# Altium schematic sheet ESP32_EC.SchDoc (part 2 of 3)
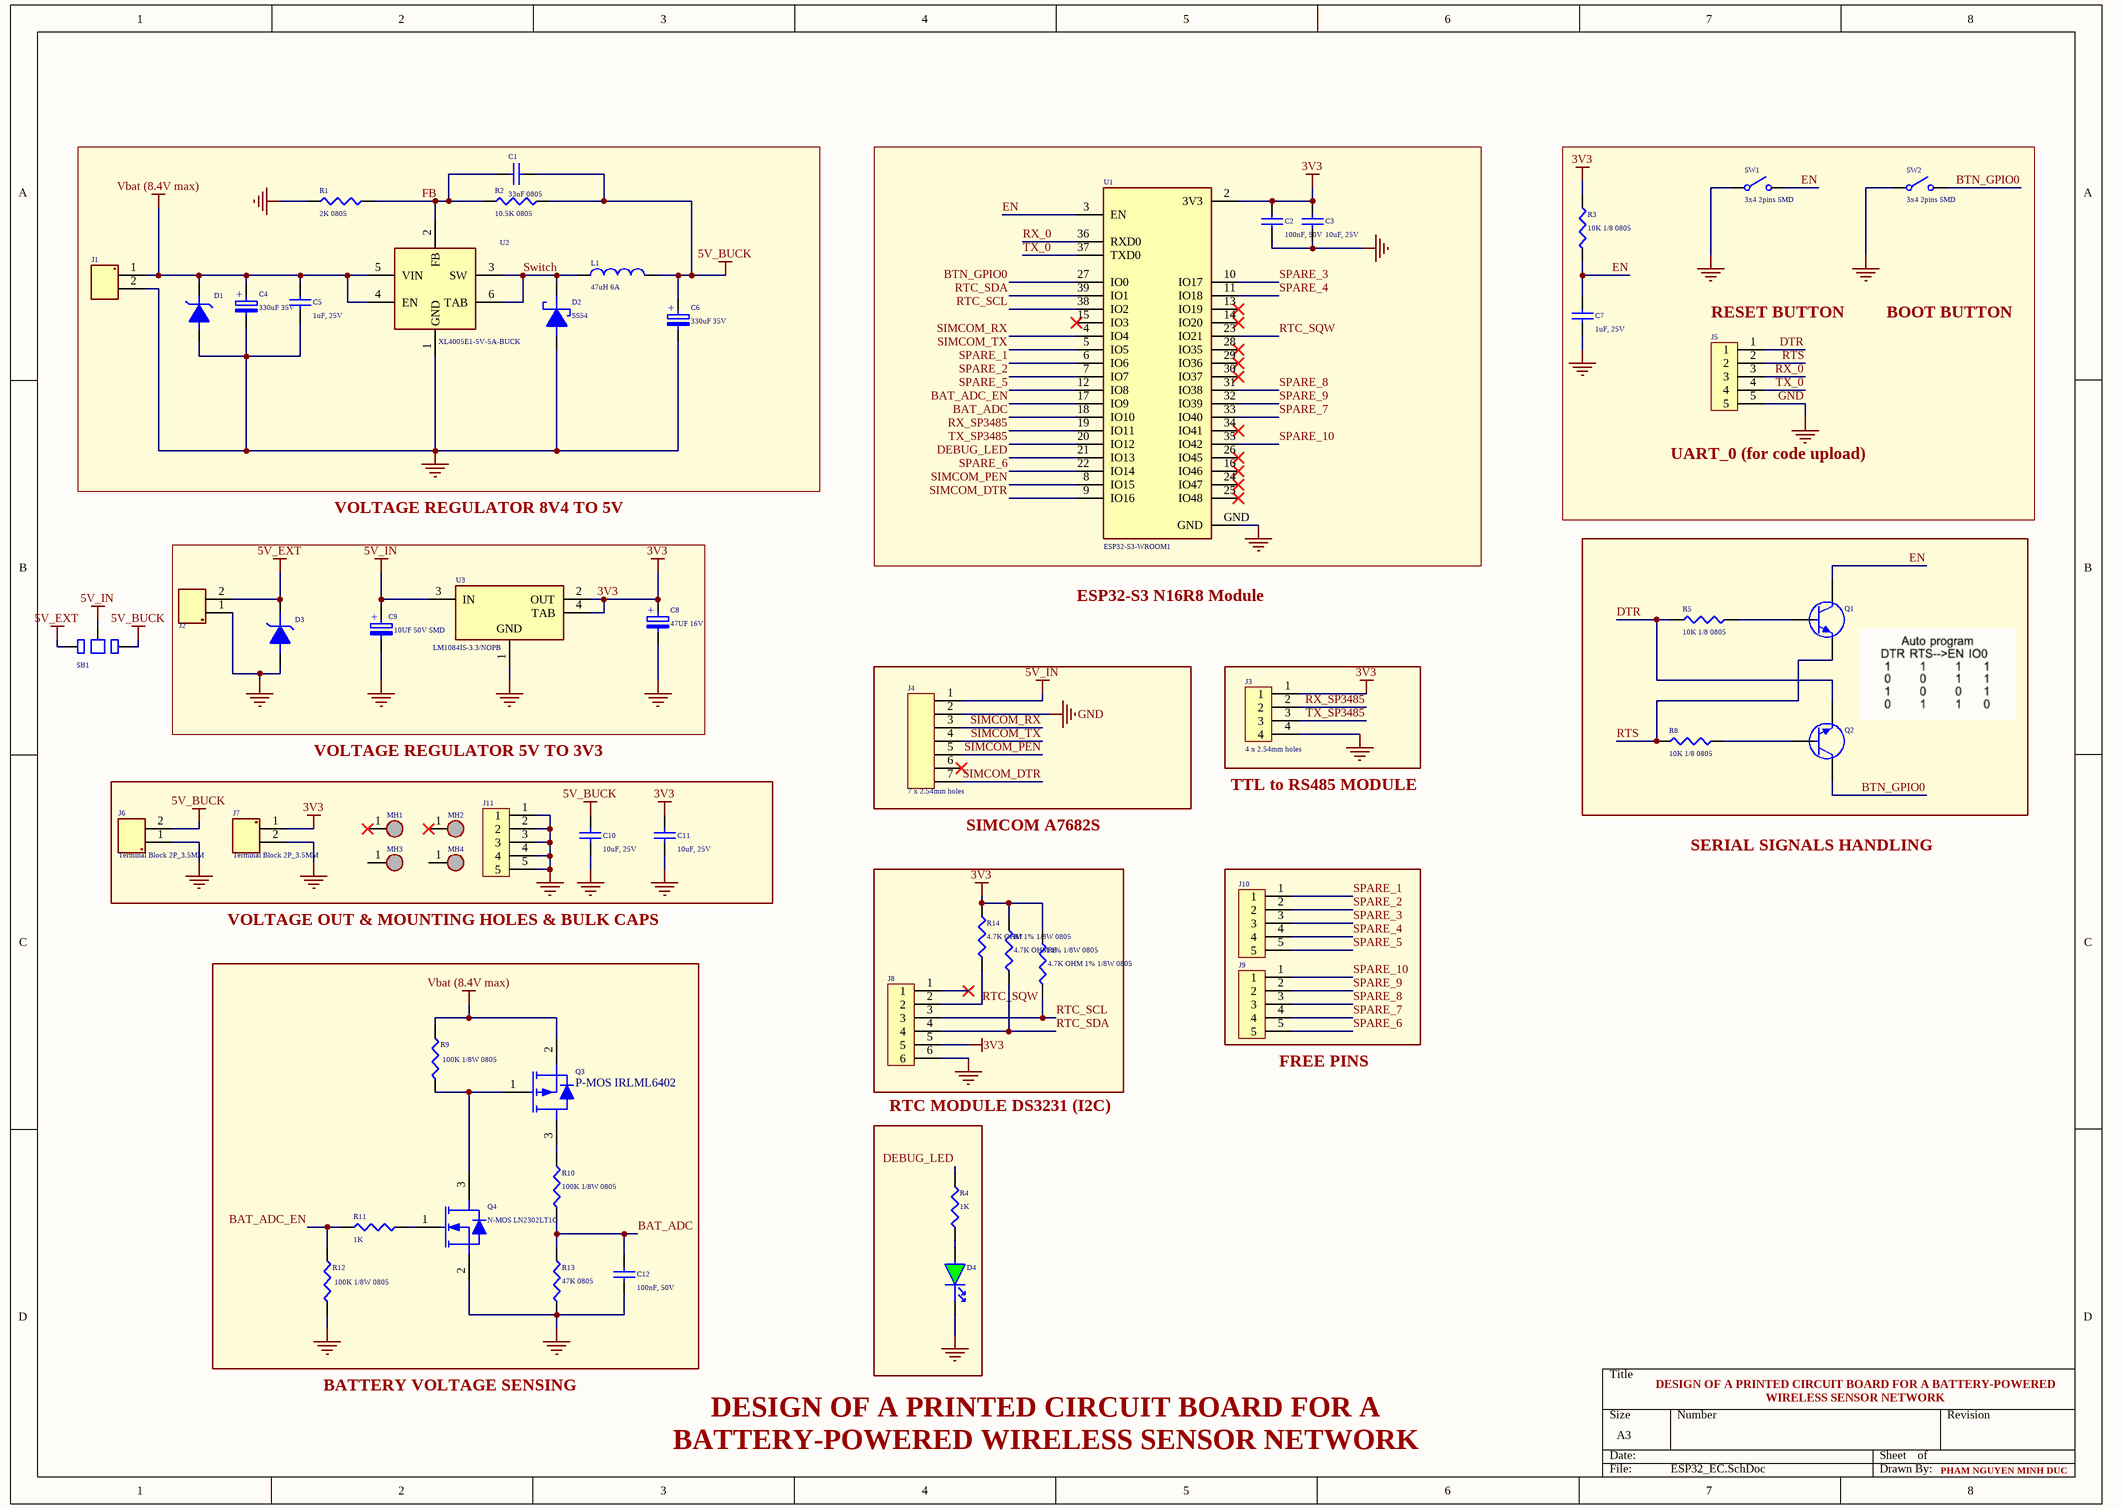
[diagram p1: ESP32_EC.SchDoc]
## Library data of the parts
C1 = C0805C333F3GEC7210: CAP CER 0805 33nF 1%; Manufacturer: KEMET; Dielectric Material: Ceramic; Voltage Rating (DC): 25V; Supplier: DigiKey; Supplier Part Number: 399-C0805C333F3GEC7210CT-ND; Manufacturer Part Number: C0805C333F3GEC7210; RoHS: Compliant; Category: Ceramic Capacitors; Stock: 4179; Pricing: 1=1.4, 10=0.879, 50=0.7314, 100=0.6728, 500=0.5736, 1000=0.54292, 2500=0.51378 (USD); Value: 33nF; Height: 1.25mm; Length: 2mm; Lifecycle Status: Production; Max Operating Temperature: 125°C; Min Operating Temperature: -55°C; Mounting Technology: Surface Mount; Number of Terminals: 2; REACH SVHC: Yes; Width: 1.25mm; ComponentLink1URL: https://datasheet.octopart.com:443/C0805C333F3GEC7210-KEMET-datasheet-176292478.pdf?src-supplier=IHS; ComponentLink1Description: https://datasheet.octopart.com:443/C0805C333F3GEC7210-KEMET-datasheet-176292478.pdf?src-supplier=IHS
C2 C12 = CL21B104KBCNNNC: 50V 100nF X7R ±10% 0805 Multilayer Ceramic Capacitors MLCC - SMD/SMT ROHS; Manufacturer: Samsung; Multilayer: Yes; Supplier: Digikey; Supplier Part Number: 1276-1003-6-ND; Manufacturer Part Number: CL21B104KBCNNNC; RoHS: Yes; Category: Ceramic Capacitors; Stock: 2034358; Pricing: 1=0.1, 10=0.035, 50=0.0238, 100=0.0203, 500=0.01446, 1000=0.01266 (USD); Mounting Technology: Surface Mount; Pins: 2; Dielectric Material: Ceramic; Package Shape: Rectangular; Case/Package: 0805; Terminal Finish: Nickel; Min Operating Temperature: -55°C; Max Operating Temperature: 125°C; JESD-609 Code: e3; Value: 100nF; Capacitor Type: Ceramic; Tolerance  (fill in as +-): 10%; Package Style: SMTMeter; Packaging: Tape and Reel; Tolerance (fill in as +-): 10%; Rated DC Voltage (URdc): 50V; Temperature Characteristics Code: X7R; Termination: Wraparound; Length: 2mm; Width: 1.25mm; Height: 0.95mm; Reach SVHC Compliant: Yes; RoHS Compliant: Yes; LCSC Part Number: C1711
C3 C10 C11 = CL21B106KAYQNNE: 25V 10uF X7R ±10% 0805 Multilayer Ceramic Capacitors MLCC - SMD/SMT ROHS; Manufacturer: Samsung; Multilayer: Yes; Supplier: Digikey; Supplier Part Number: 1276-CL21B106KAYQNNECT-ND; Manufacturer Part Number: CL21B106KAYQNNE; RoHS: Yes; Category: Ceramic Capacitors; Pricing: 1=0.35, 10=0.206, 50=0.1484, 100=0.1304, 500=0.09992, 1000=0.09042 (USD); Mounting Technology: Surface Mount; Pins: 2; Dielectric Material: Ceramic; Package Shape: Rectangular; Case/Package: 0805; Min Operating Temperature: -55°C; Max Operating Temperature: 125°C; Value: 10uF; Capacitor Type: Ceramic; Tolerance  (fill in as +-): 10%; Packaging: Tape and Reel; Tolerance (fill in as +-): 10%; Rated DC Voltage (URdc): 25V; Temperature Characteristics Code: X7R; Termination: Wraparound; Reach SVHC Compliant: Yes; RoHS Compliant: No; ComponentLink1URL: https://datasheet.ciiva.com:443/pdfs/VipMasterIC/IC/SEMS/SEMS-S-A0005593215/SEMS-S-A0005590463-1.pdf?src-supplier=IHS+Markit; ComponentLink1Description: https://datasheet.ciiva.com:443/pdfs/VipMasterIC/IC/SEMS/SEMS-S-A0005593215/SEMS-S-A0005590463-1.pdf?src-supplier=IHS+Markit; LCSC Part Number: C3039694
C4 C6 = EEH-ZS1V331P: 330uF 35V ±30% SMD,D10xL10.2mm Aluminum Electrolytic Capacitors - SMD ROHS; Manufacturer: Panasonic; Supplier: Digikey; Supplier Part Number: 10-EEH-ZS1V331PCT-ND; Manufacturer Part Number: EEH-ZS1V331P; RoHS: Yes; Category: Polymer Capacitors; Stock: 2119; Pricing: 1=2.29, 10=1.477, 50=1.1476, 100=1.045 (USD); LCSC Number Part: C2895745
C5 = CL21B105KAFNNNE: 25V 1uF X7R ±10% 0805 Multilayer Ceramic Capacitors MLCC - SMD/SMT ROHS; Manufacturer: Samsung; Multilayer: Yes; Supplier: Digikey; Supplier Part Number: 1276-1066-1-ND; Manufacturer Part Number: CL21B105KAFNNNE; RoHS: Yes; Category: Ceramic Capacitors; Stock: 1189368; Pricing: 1=0.1, 10=0.046, 50=0.0318, 100=0.0273, 500=0.01968, 1000=0.01731, 2000=0.01536, 4000=0.01375, 6000=0.01294, 10000=0.01204, 14000=0.01151, 20000=0.011, 50000=0.0099, 100000=0.00923, 200000=0.00868 (USD); Mounting Technology: Surface Mount; Pins: 2; Dielectric Material: Ceramic; Package Shape: Rectangular; Case/Package: 0805; Terminal Finish: Nickel; Min Operating Temperature: -55°C; Max Operating Temperature: 125°C; JESD-609 Code: e3; Value: 1uF; Capacitor Type: Ceramic; Tolerance  (fill in as +-): 10%; Package Style: SMTMeter; Packaging: Tape and Reel; Tolerance (fill in as +-): 10%; Rated DC Voltage (URdc): 25V; Temperature Characteristics Code: X7R; Termination: Wraparound; Length: 2mm; Width: 1.25mm; Height: 1.35mm; Reach SVHC Compliant: Yes; RoHS Compliant: Yes; ComponentLink1URL: https://datasheet.ciiva.com:443/pdfs/VipMasterIC/IC/SEMS/SEMS-S-A0008523501/SEMS-S-A0008523563-1.pdf?src-supplier=IHS+Markit; ComponentLink1Description: https://datasheet.ciiva.com:443/pdfs/VipMasterIC/IC/SEMS/SEMS-S-A0008523501/SEMS-S-A0008523563-1.pdf?src-supplier=IHS+Markit; ComponentLink2URL: https://datasheet.ciiva.com/25800/cl21b105kafnnne-25800163.pdf?src-supplier=Digikey; ComponentLink2Description: https://datasheet.ciiva.com/25800/cl21b105kafnnne-25800163.pdf?src-supplier=Digikey; ComponentLink3URL: https://datasheet.ciiva.com/15195/getdatasheetpartid-355205-15195880.pdf?src-supplier=Verical; ComponentLink3Description: https://datasheet.ciiva.com/15195/getdatasheetpartid-355205-15195880.pdf?src-supplier=Verical; LCSC Part Number: C116352
C7 = 3372-0805B105J250CCTR-ND: 1uF ±10% 50V Ceramic Capacitor X7R 0805; LCSC Part Number: C215803
C8 = 16SVPG47M: CAP ALUM POLY 47UF 20% 16V SMD D5.00; Manufacturer: Panasonic; Manufacturer Lifecycle Status: ACTIVE; Part Series: SVPG; Value: 47µF; Dissipation Factor: 12%; ESR (Equivalent Series Resistance): 25mΩ; Leakage Current: 150µA; Life (Hours): 5000hours; Material: Polymer; Polarity: Polar; Ripple Current: 160mA; Supplier: DigiKey; Supplier Part Number: P18930CT-ND; Manufacturer Part Number: 16SVPG47M; RoHS: Compliant; Category: Aluminum Electrolytic Capacitors; Stock: 12369; Pricing: 1=1.43, 10=0.92, 50=0.7086, 100=0.6416, 500=0.52624, 1000=0.48992 (USD); Case/Package: Radial; Diameter: 5mm; Height: 4.4mm; Height - Seated (Max): 4.4958mm; Length: 5.3mm; Lifecycle Status: Production; Max Operating Temperature: 105°C; Min Operating Temperature: -55°C; Mounting Technology: Surface Mount; Number of Terminals: 2; REACH SVHC: Yes; Schedule B: 8532220020, 8532220020|8532220020, 8532220020|8532220020|8532220020, 8532220020|8532220020|8532220020|8532220020; Tolerance: 20%; Voltage Rating: 16V; Voltage Rating (DC): 16V; Width: 5.3mm; ComponentLink1URL: https://datasheet.octopart.com:443/16SVPG47M-Panasonic-datasheet-182100668.pdf?src-supplier=IHS; ComponentLink1Description: https://datasheet.octopart.com:443/16SVPG47M-Panasonic-datasheet-182100668.pdf?src-supplier=IHS; ComponentLink2URL: https://datasheet.octopart.com:443/16SVPG47M-Panasonic-datasheet-62065354.pdf?src-supplier=Panasonic; ComponentLink2Description: https://datasheet.octopart.com:443/16SVPG47M-Panasonic-datasheet-62065354.pdf?src-supplier=Panasonic; ComponentLink3URL: https://sigma.octopart.com:443/138897373/technical_drawing/Panasonic-16SVPG47M.pdf?src-supplier=Upverter; ComponentLink3Description: https://sigma.octopart.com:443/138897373/technical_drawing/Panasonic-16SVPG47M.pdf?src-supplier=Upverter; ComponentLink4URL: https://datasheet.octopart.com:443/16SVPG47M-Panasonic-datasheet-102492111.pdf?src-supplier=Farnell; ComponentLink4Description: https://datasheet.octopart.com:443/16SVPG47M-Panasonic-datasheet-102492111.pdf?src-supplier=Farnell; ComponentLink5URL: https://datasheet.octopart.com:443/16SVPG47M-Panasonic-datasheet-38538411.pdf?src-supplier=Newark; ComponentLink5Description: https://datasheet.octopart.com:443/16SVPG47M-Panasonic-datasheet-38538411.pdf?src-supplier=Newark; ComponentLink6URL: https://datasheet.octopart.com:443/16SVPG47M-Panasonic-datasheet-151609408.pdf?src-supplier=Master+Electronics; ComponentLink6Description: https://datasheet.octopart.com:443/16SVPG47M-Panasonic-datasheet-151609408.pdf?src-supplier=Master+Electronics; ComponentLink7URL: https://sigma.octopart.com:443/150570690/technical_drawing/Panasonic-16SVPG47M.pdf?src-supplier=Panasonic+SCT; ComponentLink7Description: https://sigma.octopart.com:443/150570690/technical_drawing/Panasonic-16SVPG47M.pdf?src-supplier=Panasonic+SCT; ComponentLink8URL: https://datasheet.octopart.com:443/16SVPG47M-Panasonic-datasheet-138704366.pdf?src-supplier=TME; ComponentLink8Description: https://datasheet.octopart.com:443/16SVPG47M-Panasonic-datasheet-138704366.pdf?src-supplier=TME
C9 = EEH-ZA1H100R: CAP ALUM HYBRID 10UF 20% 50V SMD (D5L6P10); Manufacturer: Panasonic; Dielectric Material: Aluminium; Polarity: Polarized; ESR (Equivalent Series Resistance): 120mR; Leakage Current: 5uA; Ripple Current: 75mA; Tan Delta: 0.1; Reference Standard: AEC-Q200; Supplier: Digikey; Supplier Part Number: 10-EEH-ZA1H100RCT-ND; Manufacturer Part Number: EEH-ZA1H100R; RoHS: Yes; Category: Polymer Capacitors; Stock: 1272; Pricing: 1=1.36, 10=0.853, 50=0.6486, 100=0.5847, 500=0.47586 (USD); Mounting Technology: Surface Mount; Pins: 2; Case/Package: 2121; Min Operating Temperature: -55°C; Max Operating Temperature: 105°C; Value: 10uF; Capacitor Type: Aluminium; Tolerance  (fill in as +-): 20%; Package Style: SMTMeter; Packaging: Tape and Reel; Tolerance (fill in as +-): 20%; Rated DC Voltage (URdc): 50V; Termination: Flat; Diameter: 5mm; Length: 5.8mm; Reach SVHC Compliant: Yes; RoHS Compliant: Yes; ComponentLink1URL: https://datasheet.ciiva.com:443/pdfs/VipMasterIC/IC/PANA/PANA-S-A0009553130/PANA-S-A0009553130-1.pdf?src-supplier=IHS+Markit; ComponentLink1Description: https://datasheet.ciiva.com:443/pdfs/VipMasterIC/IC/PANA/PANA-S-A0009553130/PANA-S-A0009553130-1.pdf?src-supplier=IHS+Markit; ComponentLink2URL: https://datasheet.ciiva.com/25613/0900766b81233638-25613634.pdf?src-supplier=Rs; ComponentLink2Description: https://datasheet.ciiva.com/25613/0900766b81233638-25613634.pdf?src-supplier=Rs; ComponentLink3URL: https://datasheet.ciiva.com/22730/1536543-22730556.pdf?src-supplier=Element14; ComponentLink3Description: https://datasheet.ciiva.com/22730/1536543-22730556.pdf?src-supplier=Element14; ComponentLink4URL: https://datasheet.ciiva.com/28691/1536543-28691417.pdf?src-supplier=Element14; ComponentLink4Description: https://datasheet.ciiva.com/28691/1536543-28691417.pdf?src-supplier=Element14; ComponentLink5URL: https://datasheet.ciiva.com/7794/1536543-7794234.pdf?src-supplier=Element14; ComponentLink5Description: https://datasheet.ciiva.com/7794/1536543-7794234.pdf?src-supplier=Element14; ComponentLink6URL: https://datasheet.ciiva.com/6121/1536543-6121368.pdf?src-supplier=Farnell; ComponentLink6Description: https://datasheet.ciiva.com/6121/1536543-6121368.pdf?src-supplier=Farnell; ComponentLink7URL: https://datasheet.ciiva.com/11679/aba0000ce136-11679434.pdf?src-supplier=Avnet; ComponentLink7Description: https://datasheet.ciiva.com/11679/aba0000ce136-11679434.pdf?src-supplier=Avnet; ComponentLink8URL: https://datasheet.ciiva.com/6327/aba0000ce136-6327913.pdf?src-supplier=Digikey; ComponentLink8Description: https://datasheet.ciiva.com/6327/aba0000ce136-6327913.pdf?src-supplier=Digikey; ComponentLink9URL: https://datasheet.ciiva.com/6327/aba0000ce136-6327914.pdf?src-supplier=Digikey; ComponentLink9Description: https://datasheet.ciiva.com/6327/aba0000ce136-6327914.pdf?src-supplier=Digikey; ComponentLink10URL: https://datasheet.ciiva.com/6327/aba0000ce136-6327916.pdf?src-supplier=Digikey; ComponentLink10Description: https://datasheet.ciiva.com/6327/aba0000ce136-6327916.pdf?src-supplier=Digikey; ComponentLink11URL: https://datasheet.ciiva.com/10331/aba0000ce136-10331175.pdf?src-supplier=Avnet; ComponentLink11Description: https://datasheet.ciiva.com/10331/aba0000ce136-10331175.pdf?src-supplier=Avnet
D1 = SMAJ12A: TVS DIODE 12VWM 20.9VC DO214AC; Datasheet: https://www.littelfuse.com/~/media/electronics/datasheets/tvs_diodes/littelfuse_tvs_diode_smaj_datasheet.pdf.pdf; LCSC Number Part: C148213
D2 = SS54: Diode 40 V 5A Surface Mount DO-214AC (SMA); LCSC Number Part: C22452; Datasheet: https://www.lcsc.com/datasheet/lcsc_datasheet_2209161430_SUNMATE-Elec-SS34_C5155170.pdf
D3 = SMAJ5A: 43.5A 400W 9.2V 6.4V 5V SMA(DO-214AC) ESD and Surge Protection (TVS/ESD) ROHS; Manufacturer: Littelfuse; Manufacturer Part Number: SMAJ5.0A; LSCS Part Number: C223992; Diode Element Material: SILICON; Package Body Material: Plastic; Polarity: Unidirectional; Diode Type: TRANS VOLTAGE SUPPRESSOR; Non-rep Peak Rev Power Dis-Max: 50kW; Number of Elements: 1; Time @ Peak Reflow Temperature-Max (s): 30s; Max Breakdown Voltage: 7V; Breakdown Voltage-Nom: 6.7V; Qualification Status: Not Qualified; Supplier: Digikey; Supplier Part Number: SMAJ5.0ALFCT-ND; RoHS: Yes; Category: TVS Diodes; Stock: 63263; Pricing: 1=0.3, 10=0.205, 100=0.1376, 500=0.1061, 1000=0.09556, 2000=0.08656, 5000=0.07665, 10000=0.07044, 15000=0.06725, 25000=0.06365, 35000=0.06151, 50000=0.05942, 125000=0.05912 (USD); Pins: 2; Package Shape: Rectangular; Terminal Finish: Tin; Min Operating Temperature: -65°C; Max Operating Temperature: 150°C; JESD-609 Code: e3; Min Breakdown Voltage: 6.4V; Clamping Voltage-Max: 9.2V; JESD-30 Code: R-PDSO-C2; Moisture Sensitivity Level: 1; Package Style: SMALL OUTLINEMeter; Peak Reflow Temperature (Cel): 260°C; Surface Mount: Yes; Technology: AVALANCHE; Terminal Form: C BEND; Terminal Position: DUAL; Rep Pk Reverse Voltage-Max: 5V; JEDEC-95 Code: DO-214AC; RoHS Compliant: Yes; Reach SVHC Compliant: No; ComponentLink1URL: https://datasheet.ciiva.com:443/pdfs/VipMasterIC/IC/LFSI/LFSI-S-A0001360630/LFSI-S-A0001360630-1.pdf?src-supplier=IHS+Markit; ComponentLink1Description: https://datasheet.ciiva.com:443/pdfs/VipMasterIC/IC/LFSI/LFSI-S-A0001360630/LFSI-S-A0001360630-1.pdf?src-supplier=IHS+Markit; ComponentLink2URL: https://datasheet.ciiva.com/25624/0900766b810f4edb-25624839.pdf?src-supplier=Rs; ComponentLink2Description: https://datasheet.ciiva.com/25624/0900766b810f4edb-25624839.pdf?src-supplier=Rs; ComponentLink3URL: https://datasheet.ciiva.com/8062/littelfuse-tvs-diode-smaj-8062271.pdf?src-supplier=Element14; ComponentLink3Description: https://datasheet.ciiva.com/8062/littelfuse-tvs-diode-smaj-8062271.pdf?src-supplier=Element14; ComponentLink4URL: https://datasheet.ciiva.com/4507/littelfuse-tvs-diode-smaj-23503-4507964.pdf?src-supplier=Mouser; ComponentLink4Description: https://datasheet.ciiva.com/4507/littelfuse-tvs-diode-smaj-23503-4507964.pdf?src-supplier=Mouser; ComponentLink5URL: https://datasheet.ciiva.com/16380/littelfuse-tvs-diode-smaj-16380982.pdf?src-supplier=Future+Electronics; ComponentLink5Description: https://datasheet.ciiva.com/16380/littelfuse-tvs-diode-smaj-16380982.pdf?src-supplier=Future+Electronics
D4 = 150080VS75000: Green 570nm LED Indication - Discrete 2V 0805 (2012 Metric); Manufacturer: Wurth Electronics; Shape: Rectangular; Lens Style: WATER CLEAR; Forward Current: 30mA; Luminous Intensity-Nom: 40mcd; Channels: 1; Optoelectronic Device Type: SINGLE COLOR LED; Viewing Angle: 140°; Overall Height: 0.7mm; Supplier: Digikey; Supplier Part Number: 732-4986-1-ND; Manufacturer Part Number: 150080VS75000; RoHS: Yes; Category: LEDs; Stock: 33035; Pricing: 1=0.18, 50=0.176, 100=0.151, 500=0.131, 4000=0.131 (USD); Mounting Technology: Surface Mount; Pins: 2; Color: Green; Min Operating Temperature: -40°C; Max Operating Temperature: 85°C; Packaging: Tape and Reel; Size: 1.4mm; Terminal Pitch: 2.1mm; Reach SVHC Compliant: Yes; RoHS Compliant: Yes; ComponentLink1URL: https://datasheet.ciiva.com:443/pdfs/VipMasterIC/IC/MIDC/MIDC-S-A0007455962/MIDC-S-A0007455962-1.pdf?src-supplier=IHS+Markit; ComponentLink1Description: https://datasheet.ciiva.com:443/pdfs/VipMasterIC/IC/MIDC/MIDC-S-A0007455962/MIDC-S-A0007455962-1.pdf?src-supplier=IHS+Markit; ComponentLink2URL: https://datasheet.ciiva.com/22656/150080vs75000-22656966.pdf?src-supplier=Element14; ComponentLink2Description: https://datasheet.ciiva.com/22656/150080vs75000-22656966.pdf?src-supplier=Element14; ComponentLink3URL: https://datasheet.ciiva.com/29279/759437-da-01-en-chipled-0805-w-kl-h-gruen-150080vs7500-29279047.pdf?src-supplier=Conrad; ComponentLink3Description: https://datasheet.ciiva.com/29279/759437-da-01-en-chipled-0805-w-kl-h-gruen-150080vs7500-29279047.pdf?src-supplier=Conrad; ComponentLink4URL: https://datasheet.ciiva.com/29563/150080vs75000-29563018.pdf?src-supplier=Digikey; ComponentLink4Description: https://datasheet.ciiva.com/29563/150080vs75000-29563018.pdf?src-supplier=Digikey; LCSC Part Number: C84257
J1 J2 = Terminal Block 2P 5.0mm: 1x2P 24A -40℃~+105℃ 250V Green 12~22 Direct Insert 5mm 2.5 1 2 Plugin,P=5mm Screw Terminal Blocks ROHS; LCSC Number Part: C474950
J6 J7 = Terminal Block 2P 3.5MM: 1x2P 10A -40℃~+105℃ 300V Green 16~26 Direct Insert 3.5mm 1 1 2 Plugin,P=3.5mm Screw Terminal Blocks ROHS || KF128L-3.5-2P; LCSC Part Number: C474930
L1 = TC5026B: Toroidal Power Inductor 47uH 6A / Outer Diameter 15mm Width 8mm
MH1-MH4 = MH_5MMX2P2MM_M2: 5mm x 2.2mm Mounting Hole
Q1 Q2 = SS8050-G: 125mW Thin Film Resistor 150V ±50ppm/℃ ±1% 2kΩ 0805 Chip Resistor - Surface Mount ROHS; Manufacturer: Comchip; Temperature Coefficient: 50ppm/°C; Supplier: Digikey; Supplier Part Number: 641-1790-1-ND; Manufacturer Part Number: SS8050-G; RoHS: Yes; Category: Transistors; Stock: 93287; Pricing: 1=0.17, 10=0.113, 100=0.0755, 500=0.05756, 1000=0.05148 (USD); Reach SVHC Compliant: Yes; RoHS Compliant: Yes; ComponentLink1URL: https://datasheet.ciiva.com:443/pdfs/VipMasterIC/IC/COMC/COMC-S-A0004994192/COMC-S-A0004994192-1.pdf?src-supplier=IHS+Markit; ComponentLink1Description: https://datasheet.ciiva.com:443/pdfs/VipMasterIC/IC/COMC/COMC-S-A0004994192/COMC-S-A0004994192-1.pdf?src-supplier=IHS+Markit; ComponentLink2URL: http://www.comchiptech.com/admin/files/product/SS8050-G RevA181526.pdf?src-supplier=Digikey; ComponentLink2Description: http://www.comchiptech.com/admin/files/product/SS8050-G RevA181526.pdf?src-supplier=Digikey; LCSC Part Number: C3199946; Case/Package: 0805; Case Code (Imperial): 0805; China RoHS: Non-Compliant; Composition: Thin Film; Contact Plating: Lead, Tin; Depth: 1.25mm; Features: Moisture Resistant; Height: 500µm; Lead Free: Lead Free; Length: 2mm; Lifecycle Status: Production; Max Operating Temperature: 155°C; Max Power Dissipation: 125mW; Military Standard: Not; Min Operating Temperature: -55°C; Mounting Technology: Surface Mount; Number of Terminals: 2; Number of Terminations: 2; Power Dissipation: 125mW; Power Rating: 125mW; Radiation Hardening: No; REACH SVHC: Yes; Value: 2kΩ; Schedule B: 8533210045, 8533210045|8533210045|8533210045|8533210045|8533210045; Termination: SMD/SMT; Tolerance: 1%; Voltage Rating: 150V; Voltage Rating (DC): 150V; Weight: 5.499807mg; Width: 1.25mm; Working Voltage: 150V; ComponentLink3URL: https://datasheet.octopart.com:443/RT0805FRE072KL-Yageo-datasheet-176402239.pdf?src-supplier=Future+Electronics; ComponentLink3Description: https://datasheet.octopart.com:443/RT0805FRE072KL-Yageo-datasheet-176402239.pdf?src-supplier=Future+Electronics; ComponentLink4URL: https://datasheet.octopart.com:443/RT0805FRE072KL-Yageo-datasheet-169971040.pdf?src-supplier=Future+Electronics; ComponentLink4Description: https://datasheet.octopart.com:443/RT0805FRE072KL-Yageo-datasheet-169971040.pdf?src-supplier=Future+Electronics; ComponentLink5URL: https://datasheet.octopart.com:443/RT0805FRE072KL-Yageo-datasheet-166250672.pdf?src-supplier=Future+Electronics; ComponentLink5Description: https://datasheet.octopart.com:443/RT0805FRE072KL-Yageo-datasheet-166250672.pdf?src-supplier=Future+Electronics; ComponentLink6URL: https://datasheet.octopart.com:443/RT0805FRE072KL-Yageo-datasheet-137700930.pdf?src-supplier=Future+Electronics; ComponentLink6Description: https://datasheet.octopart.com:443/RT0805FRE072KL-Yageo-datasheet-137700930.pdf?src-supplier=Future+Electronics; ComponentLink7URL: https://datasheet.octopart.com/RT0805FRE072KL-Yageo-datasheet-86813807.pdf; ComponentLink7Description: https://datasheet.octopart.com/RT0805FRE072KL-Yageo-datasheet-86813807.pdf; ComponentLink8URL: http://sigma.octopart.com:80/conflict_mineral_statement/Yageo-company-3.pdf?src-supplier=Compliance+Statements; ComponentLink8Description: http://sigma.octopart.com:80/conflict_mineral_statement/Yageo-company-3.pdf?src-supplier=Compliance+Statements; ComponentLink9URL: http://sigma.octopart.com:80/rohs_statement/Yageo-company-2.pdf?src-supplier=Compliance+Statements; ComponentLink9Description: http://sigma.octopart.com:80/rohs_statement/Yageo-company-2.pdf?src-supplier=Compliance+Statements
Q3 = IRLML6402TRPBF: MOSFET P-CH 20V 3.7A SOT23; Manufacturer: Infineon; Manufacturer Package Identifier: Micro3; Current Rating: -3.7A; Drain to Source Breakdown Voltage: -20V; Drain to Source Resistance: 65mΩ; Element Configuration: Single; Fall Time: 381ns; Gate to Source Voltage (Vgs): 12V; Input Capacitance: 633pF; Max Junction Temperature (Tj): 150°C; Max Power Dissipation: 1.3W; Nominal Vgs: -550mV; Number of Channels: 1; Value: 65mΩ; Rise Time: 48ns; Turn-Off Delay Time: 588ns; Turn-On Delay Time: 350ns; Supplier: Arrow Electronics; Supplier Part Number: IRLML6402TRPBF; Manufacturer Part Number: IRLML6402TRPBF; RoHS: Compliant; Category: MOSFETs; Stock: 1104000; Pricing: 3000=0.0888, 6000=0.084, 9000=0.069, 24000=0.061 (USD); Case/Package: SOT-23; Contact Plating: Tin; Continuous Drain Current (ID): 3.7A; Drain to Source Voltage (Vdss): -20V; Dual Supply Voltage: -20V; Height: 1.12mm; Lead Free: Lead Free; Length: 3.0226mm; Lifecycle Status: NRND; Max Operating Temperature: 150°C; Min Breakdown Voltage: 20V; Min Operating Temperature: -55°C; Mounting Technology: Surface Mount; Number of Elements: 1; Pins: 3; Number of Terminals: 3; On-State Resistance: 65mΩ; Package Quantity: 3000; Packaging: Tape & Reel; Power Dissipation: 1.3W; Radiation Hardening: No; Rds On Max: 65mΩ; REACH SVHC: Yes; Schedule B: 8541290080, 8541290080|8541290080|8541290080|8541290080|8541290080; Termination: SMD/SMT; Threshold Voltage: -550mV; Voltage Rating (DC): -20V; ComponentLink1URL: https://datasheet.octopart.com:443/IRLML6402TRPBF-Infineon-datasheet-180073373.pdf?src-supplier=Newark; ComponentLink1Description: https://datasheet.octopart.com:443/IRLML6402TRPBF-Infineon-datasheet-180073373.pdf?src-supplier=Newark; ComponentLink2URL: https://datasheet.octopart.com:443/IRLML6402TRPBF-Infineon-datasheet-34171439.pdf?src-supplier=IHS; ComponentLink2Description: https://datasheet.octopart.com:443/IRLML6402TRPBF-Infineon-datasheet-34171439.pdf?src-supplier=IHS; ComponentLink3URL: https://datasheet.octopart.com:443/IRLML6402TRPBF-Infineon-datasheet-10897830.pdf?src-supplier=IHS; ComponentLink3Description: https://datasheet.octopart.com:443/IRLML6402TRPBF-Infineon-datasheet-10897830.pdf?src-supplier=IHS; ComponentLink4URL: https://sigma.octopart.com:443/138896058/technical_drawing/Infineon-IRLML6402TRPBF.pdf?src-supplier=Upverter; ComponentLink4Description: https://sigma.octopart.com:443/138896058/technical_drawing/Infineon-IRLML6402TRPBF.pdf?src-supplier=Upverter; ComponentLink5URL: https://datasheet.octopart.com:443/IRLML6402TRPBF-Infineon-datasheet-93882.pdf?src-supplier=element14+APAC; ComponentLink5Description: https://datasheet.octopart.com:443/IRLML6402TRPBF-Infineon-datasheet-93882.pdf?src-supplier=element14+APAC; ComponentLink6URL: https://datasheet.octopart.com:443/IRLML6402TRPBF-Infineon-datasheet-10898224.pdf?src-supplier=element14+APAC; ComponentLink6Description: https://datasheet.octopart.com:443/IRLML6402TRPBF-Infineon-datasheet-10898224.pdf?src-supplier=element14+APAC; ComponentLink7URL: https://datasheet.octopart.com:443/IRLML6402TRPBF-Infineon-datasheet-59237.pdf?src-supplier=element14+APAC; ComponentLink7Description: https://datasheet.octopart.com:443/IRLML6402TRPBF-Infineon-datasheet-59237.pdf?src-supplier=element14+APAC; ComponentLink8URL: https://datasheet.octopart.com:443/IRLML6402TRPBF-International-Rectifier-datasheet-14060680.pdf?src-supplier=iiiC; ComponentLink8Description: https://datasheet.octopart.com:443/IRLML6402TRPBF-International-Rectifier-datasheet-14060680.pdf?src-supplier=iiiC; ComponentLink9URL: https://datasheet.octopart.com:443/IRLML6402-International-Rectifier-datasheet-10848916.pdf?src-supplier=iiiC; ComponentLink9Description: https://datasheet.octopart.com:443/IRLML6402-International-Rectifier-datasheet-10848916.pdf?src-supplier=iiiC; ComponentLink10URL: https://datasheet.octopart.com:443/IRLML6402TRPBF-International-Rectifier-datasheet-17576723.pdf?src-supplier=TME; ComponentLink10Description: https://datasheet.octopart.com:443/IRLML6402TRPBF-International-Rectifier-datasheet-17576723.pdf?src-supplier=TME; ComponentLink11URL: https://datasheet.octopart.com:443/IRLML6402TRPBF-Infineon-datasheet-9963940.pdf?src-supplier=RS+(Formerly+Allied+Electronics); ComponentLink11Description: https://datasheet.octopart.com:443/IRLML6402TRPBF-Infineon-datasheet-9963940.pdf?src-supplier=RS+(Formerly+Allied+Electronics); ComponentLink12URL: https://datasheet.octopart.com:443/IRLML6402TRPBF-International-Rectifier-datasheet-7268483.pdf?src-supplier=Jameco; ComponentLink12Description: https://datasheet.octopart.com:443/IRLML6402TRPBF-International-Rectifier-datasheet-7268483.pdf?src-supplier=Jameco; ComponentLink13URL: https://datasheet.octopart.com:443/IRLML6402TRPBF-International-Rectifier-datasheet-63679.pdf?src-supplier=Farnell; ComponentLink13Description: https://datasheet.octopart.com:443/IRLML6402TRPBF-International-Rectifier-datasheet-63679.pdf?src-supplier=Farnell; ComponentLink14URL: http://sigma.octopart.com:80/conflict_mineral_statement/Infineon-company-51.pdf?src-supplier=Compliance+Statements; ComponentLink14Description: http://sigma.octopart.com:80/conflict_mineral_statement/Infineon-company-51.pdf?src-supplier=Compliance+Statements; ComponentLink15URL: http://sigma.octopart.com:80/reach_statement/International-Rectifier-company-55.pdf?src-supplier=Compliance+Statements; ComponentLink15Description: http://sigma.octopart.com:80/reach_statement/International-Rectifier-company-55.pdf?src-supplier=Compliance+Statements; ComponentLink16URL: http://sigma.octopart.com:80/rohs_statement/International-Rectifier-company-54.pdf?src-supplier=Compliance+Statements; ComponentLink16Description: http://sigma.octopart.com:80/rohs_statement/International-Rectifier-company-54.pdf?src-supplier=Compliance+Statements
Q4 = LN2302LT1G: 20V 2.3A 60mΩ@4.5V,2.8A 900mW 1.2V@250uA 1 N-Channel SOT-23 MOSFETs; Datasheet: https://www.lcsc.com/datasheet/lcsc_datasheet_1811031615_LRC-LN2302LT1G_C77962.pdf; LCSC Number Part: C77962
R1 = RT0805FRE072KL: 2K OHM 1% 1/8W 0805; LCSC Part Number: C17604
R2 = RC0805FR-0710K5L: 10.5K OHM 1% 1/8W 0805; Manufacturer: Yageo Group; Power Dissipation: 125mW; Value: 10.5kΩ; Temperature Coefficient: 100ppm/°C; Voltage Rating: 150V; Supplier: DigiKey; Supplier Part Number: 311-10.5KCRCT-ND; Manufacturer Part Number: RC0805FR-0710K5L; RoHS: Compliant; Category: Chip SMD Resistors; Stock: 14665; Pricing: 1=0.1, 10=0.014, 25=0.0112, 50=0.0092, 1000=0.00714 (USD); Case/Package: 0805; Case Code (Imperial): 0805; China RoHS: Non-Compliant; Composition: Thick Film; Contact Plating: Lead, Tin; Depth: 1.25mm; Height: 500µm; Lead Free: Lead Free; Length: 2mm; Lifecycle Status: Production; Max Operating Temperature: 155°C; Military Standard: Not; Min Operating Temperature: -55°C; Mounting Technology: Surface Mount; Number of Terminals: 2; Packaging: Tape & Reel; Power Rating: 125mW; Radiation Hardening: No; REACH SVHC: Yes; Schedule B: 8533210045, 8533210045|8533210045, 8533210045|8533210045|8533210045, 8533210045|8533210045|8533210045|8533210045; Termination: SMD/SMT; Tolerance: 1%; Width: 1.25mm; Working Voltage: 150V; ComponentLink1URL: https://datasheet.octopart.com:443/RC0805FR-0710K5L-Yageo-datasheet-175887523.pdf?src-supplier=IHS; ComponentLink1Description: https://datasheet.octopart.com:443/RC0805FR-0710K5L-Yageo-datasheet-175887523.pdf?src-supplier=IHS; ComponentLink2URL: https://datasheet.octopart.com:443/RC0805FR-0710K5L-Yageo-datasheet-103092701.pdf?src-supplier=Upverter; ComponentLink2Description: https://datasheet.octopart.com:443/RC0805FR-0710K5L-Yageo-datasheet-103092701.pdf?src-supplier=Upverter; ComponentLink3URL: https://datasheet.octopart.com:443/RC0805FR-0710K5L-Yageo-datasheet-8330313.pdf?src-supplier=Future+Electronics; ComponentLink3Description: https://datasheet.octopart.com:443/RC0805FR-0710K5L-Yageo-datasheet-8330313.pdf?src-supplier=Future+Electronics; ComponentLink4URL: https://datasheet.octopart.com:443/RC0805FR-0710K5L-Yageo-Group-datasheet-176638170.pdf?src-supplier=Future+Electronics; ComponentLink4Description: https://datasheet.octopart.com:443/RC0805FR-0710K5L-Yageo-Group-datasheet-176638170.pdf?src-supplier=Future+Electronics; ComponentLink5URL: https://datasheet.octopart.com:443/RC0805FR-0710K5L-Yageo-datasheet-164759695.pdf?src-supplier=Future+Electronics; ComponentLink5Description: https://datasheet.octopart.com:443/RC0805FR-0710K5L-Yageo-datasheet-164759695.pdf?src-supplier=Future+Electronics; ComponentLink6URL: https://datasheet.octopart.com:443/RC0805FR-0710K5L-Yageo-datasheet-12592811.pdf?src-supplier=Future+Electronics; ComponentLink6Description: https://datasheet.octopart.com:443/RC0805FR-0710K5L-Yageo-datasheet-12592811.pdf?src-supplier=Future+Electronics; ComponentLink7URL: https://datasheet.octopart.com:443/RC0805FR-0710K5L-Yageo-datasheet-8324252.pdf?src-supplier=Future+Electronics; ComponentLink7Description: https://datasheet.octopart.com:443/RC0805FR-0710K5L-Yageo-datasheet-8324252.pdf?src-supplier=Future+Electronics; ComponentLink8URL: https://datasheet.octopart.com:443/RC0805FR-0710K5L-Yageo-datasheet-141265859.pdf?src-supplier=TME; ComponentLink8Description: https://datasheet.octopart.com:443/RC0805FR-0710K5L-Yageo-datasheet-141265859.pdf?src-supplier=TME; ComponentLink9URL: https://datasheet.octopart.com/RC0805FR-0710K5L-Yageo-datasheet-73766026.pdf; ComponentLink9Description: https://datasheet.octopart.com/RC0805FR-0710K5L-Yageo-datasheet-73766026.pdf; ComponentLink10URL: https://datasheet.octopart.com:443/RC0805FR-0710K5L-Yageo-datasheet-118657.pdf?src-supplier=DigiKey; ComponentLink10Description: https://datasheet.octopart.com:443/RC0805FR-0710K5L-Yageo-datasheet-118657.pdf?src-supplier=DigiKey; ComponentLink11URL: http://sigma.octopart.com:80/conflict_mineral_statement/Yageo-company-3.pdf?src-supplier=Compliance+Statements; ComponentLink11Description: http://sigma.octopart.com:80/conflict_mineral_statement/Yageo-company-3.pdf?src-supplier=Compliance+Statements; ComponentLink12URL: http://sigma.octopart.com:80/rohs_statement/Yageo-company-2.pdf?src-supplier=Compliance+Statements; ComponentLink12Description: http://sigma.octopart.com:80/rohs_statement/Yageo-company-2.pdf?src-supplier=Compliance+Statements; LCSC Part Number: C2093736
R3 R5 R8 = RC0805JR-0710KL: 10K OHM 5% 1/8W 0805; Manufacturer: Yageo; Additional Feature: LASER TRIMMABLE; Power: 125mW; Rated Temperature: 70°C; Value: 10kR; Temperature Coefficient: 100ppm/°C; Working Voltage: 150V; Package Height: 0.5mm; Package Length: 2mm; Package Width: 1.25mm; Supplier: Digikey; Supplier Part Number: 311-10KARCT-ND; Manufacturer Part Number: RC0805JR-0710KL; RoHS: Yes; Category: Chip SMD Resistors; Stock: 306810; Pricing: 1=0.1, 10=0.015, 50=0.0122, 100=0.0092, 500=0.00764, 1000=0.00612, 5000=0.00306, 10000=0.00291, 15000=0.00274 (USD); Mounting Technology: Surface Mount; Pins: 2; Package Shape: Rectangular; Case/Package: 0805; Terminal Finish: Nickel; Min Operating Temperature: -55°C; Max Operating Temperature: 155°C; Tolerance: 5%; JESD-609 Code: e3; Resistor Type: FIXED RESISTOR; Construction: Chip; Package Style: SMTMeter; Packaging: Tape and Reel; Technology: METAL GLAZE/THICK FILM; Termination: Wraparound; Reach SVHC Compliant: Yes; RoHS Compliant: Yes; ComponentLink1URL: https://datasheet.ciiva.com:443/pdfs/VipMasterIC/IC/YAGO/YAGO-S-A0008145938/YAGO-S-A0008145938-1.pdf?src-supplier=IHS+Markit; ComponentLink1Description: https://datasheet.ciiva.com:443/pdfs/VipMasterIC/IC/YAGO/YAGO-S-A0008145938/YAGO-S-A0008145938-1.pdf?src-supplier=IHS+Markit; ComponentLink2URL: https://datasheet.ciiva.com/7983/444164-7983765.pdf?src-supplier=Element14; ComponentLink2Description: https://datasheet.ciiva.com/7983/444164-7983765.pdf?src-supplier=Element14; ComponentLink3URL: https://datasheet.ciiva.com/7941/444164-7941870.pdf?src-supplier=Element14; ComponentLink3Description: https://datasheet.ciiva.com/7941/444164-7941870.pdf?src-supplier=Element14; ComponentLink4URL: https://datasheet.ciiva.com/7941/444164-7941871.pdf?src-supplier=Element14; ComponentLink4Description: https://datasheet.ciiva.com/7941/444164-7941871.pdf?src-supplier=Element14; LCSC Part Number: C100047
R4 R11 = RC0805FR-071KL: 1 kOhms ±1% 0.125W, 1/8W Chip Resistor 0805 (2012 Metric) Moisture Resistant Thick Film; Manufacturer: Yageo; Additional Feature: LASER TRIMMABLE; Power: 125mW; Rated Temperature: 70°C; Value: 1kR; Temperature Coefficient: 100ppm/°C; Working Voltage: 150V; Package Height: 0.5mm; Package Length: 2mm; Package Width: 1.25mm; Supplier: Digikey; Supplier Part Number: 311-1.00KCRCT-ND; Manufacturer Part Number: RC0805FR-071KL; RoHS: Yes; Category: Chip SMD Resistors; Stock: 1656654; Pricing: 1=0.1, 10=0.016, 50=0.0132, 500=0.00868, 1000=0.00714, 5000=0.00408, 10000=0.00306 (USD); Mounting Technology: Surface Mount; Pins: 2; Package Shape: Rectangular; Case/Package: 0805; Terminal Finish: Nickel; Min Operating Temperature: -55°C; Max Operating Temperature: 155°C; Tolerance: 1%; JESD-609 Code: e3; Resistor Type: FIXED RESISTOR; Construction: Chip; Package Style: SMTMeter; Packaging: Tape and Reel; Technology: METAL GLAZE/THICK FILM; Termination: Wraparound; Reach SVHC Compliant: Yes; RoHS Compliant: Yes; ComponentLink1URL: https://datasheet.ciiva.com:443/pdfs/VipMasterIC/IC/YAGO/YAGO-S-A0008145938/YAGO-S-A0008145938-1.pdf?src-supplier=IHS+Markit; ComponentLink1Description: https://datasheet.ciiva.com:443/pdfs/VipMasterIC/IC/YAGO/YAGO-S-A0008145938/YAGO-S-A0008145938-1.pdf?src-supplier=IHS+Markit; LCSC Part Number: C95781
R6 R7 R14 = RC0805FR-074K7L: 4.7 kOhms ±1% 0.125W, 1/8W Chip Resistor 0805 (2012 Metric) Moisture Resistant Thick Film; Manufacturer: Yageo Group; Max Power Dissipation: 125mW; Value: 4.7kΩ; Temperature Coefficient: 100ppm/°C; Voltage Rating: 150V; Supplier: DigiKey; Supplier Part Number: 311-4.70KCRCT-ND; Manufacturer Part Number: RC0805FR-074K7L; RoHS: Compliant; Category: Chip SMD Resistors; Stock: 89581; Pricing: 1=0.1, 10=0.03, 25=0.0224, 50=0.018, 100=0.0147, 250=0.01152, 500=0.00972, 1000=0.00829 (USD); Case/Package: 0805; Case Code (Imperial): 0805; China RoHS: Non-Compliant; Composition: Thick Film; Depth: 1.25mm; Features: Moisture Resistant; Height: 500µm; Lead Free: Lead Free; Lifecycle Status: Production; Max Operating Temperature: 155°C; Military Standard: Not; Min Operating Temperature: -55°C; Mounting Technology: Surface Mount; Pins: 2; Number of Terminals: 2; Number of Terminations: 2; Packaging: Tape and Reel; Power Dissipation: 125mW; Power Rating: 125mW; REACH SVHC: Yes; Schedule B: 8533210045, 8533210045|8533210045|8533210045|8533210045|8533210045|8533210045|8533210045|8533210045|8533210045|8533210045|8533210045|8533210045|8533210045, 8533210045|8533210045|8533210045|8533210045|8533210045|8533210045|8533210045|8533210045|8533210045|8533210045|8533210045|8533210045|8533210045|8533210045, 8533210045|8533210045|8533210045|8533210045|8533210045|8533210045|8533210045|8533210045|8533210045|8533210045|8533210045|8533210045|8533210045|8533210045|8533210045; Termination: SMD/SMT; Tolerance: 1%; Voltage Rating (AC): 150V; Voltage Rating (DC): 150V; Width: 1.25mm; Working Voltage: 150V; ComponentLink1URL: https://datasheet.octopart.com:443/RC0805FR-074K7L-Yageo-datasheet-175887523.pdf?src-supplier=IHS; ComponentLink1Description: https://datasheet.octopart.com:443/RC0805FR-074K7L-Yageo-datasheet-175887523.pdf?src-supplier=IHS; ComponentLink2URL: https://datasheet.octopart.com:443/RC0805FR-074K7L-Yageo-datasheet-103092701.pdf?src-supplier=Upverter; ComponentLink2Description: https://datasheet.octopart.com:443/RC0805FR-074K7L-Yageo-datasheet-103092701.pdf?src-supplier=Upverter; ComponentLink3URL: https://datasheet.octopart.com:443/RC0805FR-074K7L-Yageo-datasheet-98239111.pdf?src-supplier=Upverter; ComponentLink3Description: https://datasheet.octopart.com:443/RC0805FR-074K7L-Yageo-datasheet-98239111.pdf?src-supplier=Upverter; ComponentLink4URL: https://datasheet.octopart.com:443/RC0805FR-074K7L-Yageo-datasheet-45841575.pdf?src-supplier=Upverter; ComponentLink4Description: https://datasheet.octopart.com:443/RC0805FR-074K7L-Yageo-datasheet-45841575.pdf?src-supplier=Upverter; ComponentLink5URL: https://datasheet.octopart.com:443/RC0805FR-074K7L-Yageo-datasheet-8330313.pdf?src-supplier=Newark; ComponentLink5Description: https://datasheet.octopart.com:443/RC0805FR-074K7L-Yageo-datasheet-8330313.pdf?src-supplier=Newark; ComponentLink6URL: https://datasheet.octopart.com:443/RC0805FR-074K7L-Yageo-datasheet-12592811.pdf?src-supplier=element14+APAC; ComponentLink6Description: https://datasheet.octopart.com:443/RC0805FR-074K7L-Yageo-datasheet-12592811.pdf?src-supplier=element14+APAC; ComponentLink7URL: https://datasheet.octopart.com:443/RC0805FR-074K7L-Yageo-datasheet-62067350.pdf?src-supplier=element14+APAC; ComponentLink7Description: https://datasheet.octopart.com:443/RC0805FR-074K7L-Yageo-datasheet-62067350.pdf?src-supplier=element14+APAC; ComponentLink8URL: https://datasheet.octopart.com:443/RC0805FR-074K7L-Yageo-datasheet-164759695.pdf?src-supplier=Future+Electronics; ComponentLink8Description: https://datasheet.octopart.com:443/RC0805FR-074K7L-Yageo-datasheet-164759695.pdf?src-supplier=Future+Electronics; ComponentLink9URL: https://datasheet.octopart.com:443/RC0805FR-074K7L-Yageo-datasheet-8324252.pdf?src-supplier=Future+Electronics; ComponentLink9Description: https://datasheet.octopart.com:443/RC0805FR-074K7L-Yageo-datasheet-8324252.pdf?src-supplier=Future+Electronics; ComponentLink10URL: https://datasheet.octopart.com/RC0805FR-074K7L-Yageo-datasheet-73766026.pdf; ComponentLink10Description: https://datasheet.octopart.com/RC0805FR-074K7L-Yageo-datasheet-73766026.pdf; ComponentLink11URL: https://datasheet.octopart.com:443/RC0805FR-074K7L-Yageo-datasheet-13691069.pdf?src-supplier=Farnell; ComponentLink11Description: https://datasheet.octopart.com:443/RC0805FR-074K7L-Yageo-datasheet-13691069.pdf?src-supplier=Farnell; ComponentLink12URL: https://datasheet.octopart.com:443/RC0805FR-074K7L-Yageo-datasheet-118657.pdf?src-supplier=DigiKey; ComponentLink12Description: https://datasheet.octopart.com:443/RC0805FR-074K7L-Yageo-datasheet-118657.pdf?src-supplier=DigiKey; ComponentLink13URL: http://sigma.octopart.com:80/conflict_mineral_statement/Yageo-company-3.pdf?src-supplier=Compliance+Statements; ComponentLink13Description: http://sigma.octopart.com:80/conflict_mineral_statement/Yageo-company-3.pdf?src-supplier=Compliance+Statements; ComponentLink14URL: http://sigma.octopart.com:80/rohs_statement/Yageo-company-2.pdf?src-supplier=Compliance+Statements; ComponentLink14Description: http://sigma.octopart.com:80/rohs_statement/Yageo-company-2.pdf?src-supplier=Compliance+Statements; LCSC Part Number: C17673
R9 R10 R12 = RC0805FR-07100KL: 100K OHM 1% 1/8W 0805; Manufacturer: Yageo Group; Max Power Dissipation: 125mW; Value: 100kΩ; Temperature Coefficient: 100ppm/°C; Voltage Rating: 150V; Supplier: DigiKey; Supplier Part Number: 311-100KCRCT-ND; Manufacturer Part Number: RC0805FR-07100KL; RoHS: Compliant; Category: Chip SMD Resistors; Stock: 934885; Pricing: 1=0.1, 10=0.03, 25=0.0224, 50=0.018, 100=0.0147, 250=0.01152, 500=0.00972, 1000=0.00829 (USD); Case/Package: 0805; Case Code (Imperial): 0805; China RoHS: Non-Compliant; Composition: Thick Film; Depth: 1.25mm; Features: Moisture Resistant; Height: 500µm; Lead Free: Lead Free; Lead Pitch: 400µm; Length: 2mm; Lifecycle Status: Production; Max Operating Temperature: 155°C; Military Standard: Not; Min Operating Temperature: -55°C; Mounting Technology: Surface Mount; Pins: 2; Number of Terminals: 2; Number of Terminations: 2; Packaging: Tape & Reel; Power Dissipation: 125mW; Power Rating: 125mW; REACH SVHC: Yes; Schedule B: 8533210045, 8533210045|8533210045, 8533210045|8533210045|8533210045, 8533210045|8533210045|8533210045|8533210045; Termination: SMD/SMT; Tolerance: 1%; Voltage Rating (AC): 150V; Voltage Rating (DC): 150V; Width: 1.25mm; Working Voltage: 150V; ComponentLink1URL: https://datasheet.octopart.com:443/RC0805FR-07100KL-Yageo-datasheet-175887523.pdf?src-supplier=IHS; ComponentLink1Description: https://datasheet.octopart.com:443/RC0805FR-07100KL-Yageo-datasheet-175887523.pdf?src-supplier=IHS; ComponentLink2URL: https://datasheet.octopart.com:443/RC0805FR-07100KL-Yageo-datasheet-164759695.pdf?src-supplier=Upverter; ComponentLink2Description: https://datasheet.octopart.com:443/RC0805FR-07100KL-Yageo-datasheet-164759695.pdf?src-supplier=Upverter; ComponentLink3URL: https://datasheet.octopart.com:443/RC0805FR-07100KL-Yageo-datasheet-103092701.pdf?src-supplier=Upverter; ComponentLink3Description: https://datasheet.octopart.com:443/RC0805FR-07100KL-Yageo-datasheet-103092701.pdf?src-supplier=Upverter; ComponentLink4URL: https://sigma.octopart.com:443/138820526/technical_drawing/Yageo-RC0805FR-07100KL.pdf?src-supplier=Upverter; ComponentLink4Description: https://sigma.octopart.com:443/138820526/technical_drawing/Yageo-RC0805FR-07100KL.pdf?src-supplier=Upverter; ComponentLink5URL: https://datasheet.octopart.com:443/RC0805FR-07100KL-Yageo-datasheet-118657.pdf?src-supplier=DigiKey; ComponentLink5Description: https://datasheet.octopart.com:443/RC0805FR-07100KL-Yageo-datasheet-118657.pdf?src-supplier=DigiKey; ComponentLink6URL: https://datasheet.octopart.com:443/RC0805FR-07100KL-Yageo-datasheet-8330313.pdf?src-supplier=element14+APAC; ComponentLink6Description: https://datasheet.octopart.com:443/RC0805FR-07100KL-Yageo-datasheet-8330313.pdf?src-supplier=element14+APAC; ComponentLink7URL: https://datasheet.octopart.com:443/RC0805FR-07100KL-Yageo-datasheet-12592811.pdf?src-supplier=element14+APAC; ComponentLink7Description: https://datasheet.octopart.com:443/RC0805FR-07100KL-Yageo-datasheet-12592811.pdf?src-supplier=element14+APAC; ComponentLink8URL: https://datasheet.octopart.com:443/RC0805FR-07100KL-Yageo-datasheet-62067350.pdf?src-supplier=Farnell; ComponentLink8Description: https://datasheet.octopart.com:443/RC0805FR-07100KL-Yageo-datasheet-62067350.pdf?src-supplier=Farnell; ComponentLink9URL: https://datasheet.octopart.com:443/RC0805FR-07100KL-Yageo-datasheet-13691069.pdf?src-supplier=Farnell; ComponentLink9Description: https://datasheet.octopart.com:443/RC0805FR-07100KL-Yageo-datasheet-13691069.pdf?src-supplier=Farnell; ComponentLink10URL: https://datasheet.octopart.com:443/RC0805FR-07100KL-Yageo-datasheet-127823281.pdf?src-supplier=Future+Electronics; ComponentLink10Description: https://datasheet.octopart.com:443/RC0805FR-07100KL-Yageo-datasheet-127823281.pdf?src-supplier=Future+Electronics; ComponentLink11URL: https://datasheet.octopart.com:443/RC0805FR-07100KL-Yageo-datasheet-137700087.pdf?src-supplier=Future+Electronics; ComponentLink11Description: https://datasheet.octopart.com:443/RC0805FR-07100KL-Yageo-datasheet-137700087.pdf?src-supplier=Future+Electronics; ComponentLink12URL: https://datasheet.octopart.com:443/RC0805FR-07100KL-Yageo-datasheet-77992522.pdf?src-supplier=Future+Electronics; ComponentLink12Description: https://datasheet.octopart.com:443/RC0805FR-07100KL-Yageo-datasheet-77992522.pdf?src-supplier=Future+Electronics; ComponentLink13URL: https://datasheet.octopart.com:443/RC0805FR-07100KL-Yageo-datasheet-80324437.pdf?src-supplier=Future+Electronics; ComponentLink13Description: https://datasheet.octopart.com:443/RC0805FR-07100KL-Yageo-datasheet-80324437.pdf?src-supplier=Future+Electronics; ComponentLink14URL: https://datasheet.octopart.com:443/RC0805FR-07100KL-Yageo-datasheet-67302840.pdf?src-supplier=Future+Electronics; ComponentLink14Description: https://datasheet.octopart.com:443/RC0805FR-07100KL-Yageo-datasheet-67302840.pdf?src-supplier=Future+Electronics; ComponentLink15URL: https://datasheet.octopart.com:443/RC0805FR-07100KL-Yageo-datasheet-8324252.pdf?src-supplier=Future+Electronics; ComponentLink15Description: https://datasheet.octopart.com:443/RC0805FR-07100KL-Yageo-datasheet-8324252.pdf?src-supplier=Future+Electronics; ComponentLink16URL: https://datasheet.octopart.com:443/RC0805FR-07100KL-Yageo-datasheet-79472498.pdf?src-supplier=Megastar; ComponentLink16Description: https://datasheet.octopart.com:443/RC0805FR-07100KL-Yageo-datasheet-79472498.pdf?src-supplier=Megastar; ComponentLink17URL: https://datasheet.octopart.com:443/RC0805FR-07100KL-Yageo-datasheet-27714392.pdf?src-supplier=Seeed+Studio; ComponentLink17Description: https://datasheet.octopart.com:443/RC0805FR-07100KL-Yageo-datasheet-27714392.pdf?src-supplier=Seeed+Studio; ComponentLink18URL: https://datasheet.octopart.com/RC0805FR-07100KL-Yageo-datasheet-73766026.pdf; ComponentLink18Description: https://datasheet.octopart.com/RC0805FR-07100KL-Yageo-datasheet-73766026.pdf; ComponentLink19URL: https://datasheet.octopart.com:443/RC0805FR-07100KL-Yageo-datasheet-502840.pdf?src-supplier=element14; ComponentLink19Description: https://datasheet.octopart.com:443/RC0805FR-07100KL-Yageo-datasheet-502840.pdf?src-supplier=element14; ComponentLink20URL: http://sigma.octopart.com:80/conflict_mineral_statement/Yageo-company-3.pdf?src-supplier=Compliance+Statements; ComponentLink20Description: http://sigma.octopart.com:80/conflict_mineral_statement/Yageo-company-3.pdf?src-supplier=Compliance+Statements; ComponentLink21URL: http://sigma.octopart.com:80/rohs_statement/Yageo-company-2.pdf?src-supplier=Compliance+Statements; ComponentLink21Description: http://sigma.octopart.com:80/rohs_statement/Yageo-company-2.pdf?src-supplier=Compliance+Statements; LCSC Part Number: C96346